# Altium project AHPR_Power_Management_and_Controls_Board.PrjPcb (part 2 of 2)

## Sheet Pi_Interface_and_IO.SchDoc
size 431 x 279 mm; SheetNumber: 5; SheetTotal: 5
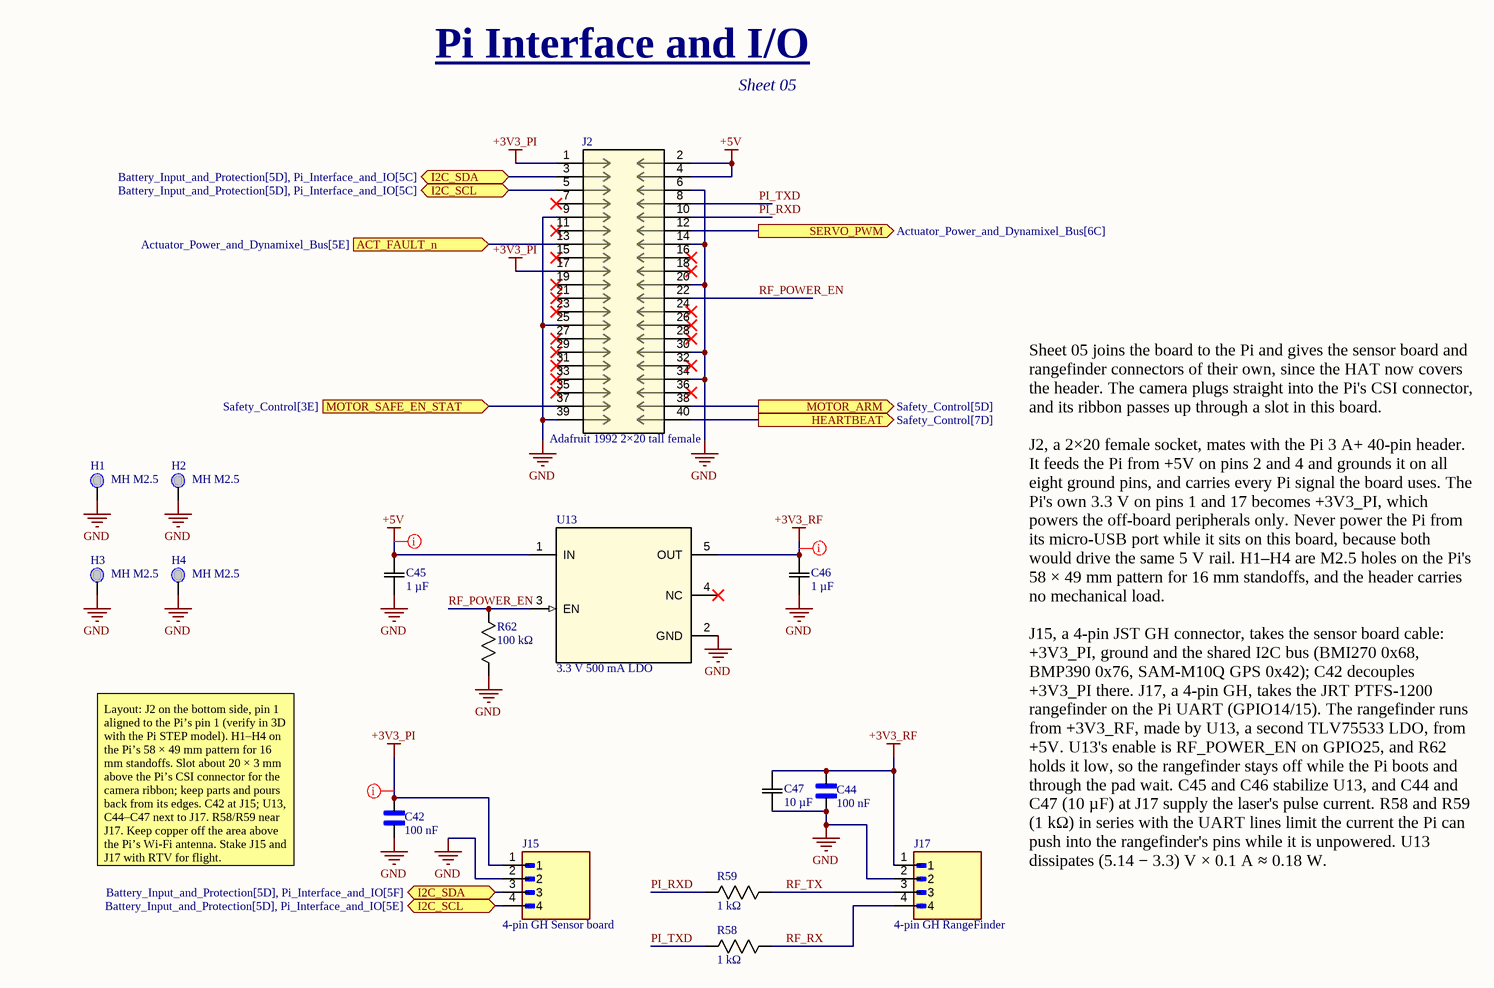
[diagram p4: Pi_Interface_and_IO.SchDoc]

### Parts
C42  100 nF  [CAPC1608X90N]
C44  100 nF  [CAPC1608X90N]
C45  1 µF  [G-188_MUR]
C46  1 µF  [G-188_MUR]
C47  10 µF  [CAP_GRM21_2p15X1p4X1p4_MUR]
H1  MH M2.5  [MH_M2.5_PLATED]
H2  MH M2.5  [MH_M2.5_PLATED]
H3  MH M2.5  [MH_M2.5_PLATED]
H4  MH M2.5  [MH_M2.5_PLATED]
J2  Adafruit 1992 2×20 tall female  [CONN_PRT-14017_SPK]
J15  4-pin GH Sensor board  [JST_SM04B-GHS-TB]
J17  4-pin GH RangeFinder  [JST_SM04B-GHS-TB]
R58  1 kΩ  [RC0603N_YAG]
R59  1 kΩ  [RC0603N_YAG]
R62  100 kΩ  [RC0603N_YAG]
U13  3.3 V 500 mA LDO  [DBV0005A_N]

### Ports
ACT_FAULT_n (in, see Actuator_Power_and_Dynamixel_Bus[5E]), HEARTBEAT (out, see Safety_Control[7D]), I2C_SCL (bidir, see Battery_Input_and_Protection[5D], Pi_Interface_and_IO[5C]), I2C_SCL (bidir, see Battery_Input_and_Protection[5D], Pi_Interface_and_IO[5E]), I2C_SDA (bidir, see Battery_Input_and_Protection[5D], Pi_Interface_and_IO[5C]), I2C_SDA (bidir, see Battery_Input_and_Protection[5D], Pi_Interface_and_IO[5F]), MOTOR_ARM (out, see Safety_Control[5D]), MOTOR_SAFE_EN_STAT (in, see Safety_Control[3E]), SERVO_PWM (out, see Actuator_Power_and_Dynamixel_Bus[6C])

### Nets
+3V3_PI: C42.2 J2.1 J2.17 J15.1
+3V3_RF: C44.2 C46.2 C47.2 J17.1 U13.5(OUT)
+5V: C45.2 J2.2 J2.4 U13.1(IN)
GND: C42.1 C44.1 C45.1 C46.1 C47.1 H1.1(MH) H2.1(MH) H3.1(MH) H4.1(MH) J2.6 J2.9 J2.14 J2.20 J2.25 J2.30 J2.34 J2.39 J15.2 J17.2 R62.1 U13.2(GND)
ACT_FAULT_n: J2.13 ; port ACT_FAULT_n
HEARTBEAT: J2.40 ; port HEARTBEAT
I2C_SCL: J2.5 J15.4 ; port I2C_SCL
I2C_SDA: J2.3 J15.3 ; port I2C_SDA
MOTOR_ARM: J2.38 ; port MOTOR_ARM
MOTOR_SAFE_EN_STAT: J2.37 ; port MOTOR_SAFE_EN_STAT
PI_RXD: J2.10 R59.1
PI_TXD: J2.8 R58.1
RF_POWER_EN: J2.22 R62.2 U13.3(EN)
RF_RX: J17.4 R58.2
RF_TX: J17.3 R59.2
SERVO_PWM: J2.12 ; port SERVO_PWM

Not connected (* = marked no-connect by the designer): J2 7* 11* 15* 16* 18* 19* 21* 23* 24* 26* 27* 28* 29* 31* 32* 33* 35* 36*; U13 4(NC)*

### Layout directives
net class POWER_HI: +5V
net class POWER_LO: +3V3_PI, +3V3_RF

### Notes on the sheet
- Pi Interface and I/O
- Sheet 05
- Layout: J2 on the bottom side, pin 1 aligned to the Pi’s pin 1 (verify in 3D with the Pi STEP model). H1–H4 on the Pi’s 58 × 49 mm pattern for 16 mm standoffs. Slot about 20 × 3 mm above the Pi’s CSI connector for the camera ribbon; keep parts and pours back from its edges. C42 at J15; U13, C44–C47 next to J17. R58/R59 near J17. Keep copper off the area above the Pi’s Wi-Fi antenna. Stake J15 and J17 with RTV for flight.
- Sheet 05 joins the board to the Pi and gives the sensor board and rangefinder connectors of their own, since the HAT now covers the header. The camera plugs straight into the Pi's CSI connector, and its ribbon passes up through a slot in this board.
  J2, a 2×20 female socket, mates with the Pi 3 A+ 40-pin header. It feeds the Pi from +5V on pins 2 and 4 and grounds it on all eight ground pins, and carries every Pi signal the board uses. The Pi's own 3.3 V on pins 1 and 17 becomes +3V3_PI, which powers the off-board peripherals only. Never power the Pi from its micro-USB port while it sits on this board, because both would drive the same 5 V rail. H1–H4 are M2.5 holes on the Pi's 58 × 49 mm pattern for 16 mm standoffs, and the header carries no mechanical load.
  J15, a 4-pin JST GH connector, takes the sensor board cable: +3V3_PI, ground and the shared I2C bus (BMI270 0x68, BMP390 0x76, SAM-M10Q GPS 0x42); C42 decouples +3V3_PI there. J17, a 4-pin GH, takes the JRT PTFS-1200 rangefinder on the Pi UART (GPIO14/15). The rangefinder runs from +3V3_RF, made by U13, a second TLV75533 LDO, from +5V. U13's enable is RF_POWER_EN on GPIO25, and R62 holds it low, so the rangefinder stays off while the Pi boots and through the pad wait. C45 and C46 stabilize U13, and C44 and C47 (10 µF) at J17 supply the laser's pulse current. R58 and R59 (1 kΩ) in series with the UART lines limit the current the Pi can push into the rangefinder's pins while it is unpowered. U13 dissipates (5.14 − 3.3) V × 0.1 A ≈ 0.18 W.
- DWG. NO.
- REV.
- SHT.
- THIS DOCUMENT AND THE DATA DISCLOSED HEREIN OR HEREWITH IS THE PROPERTY OF ALTIUM LIMITED AND MAY BE FREELY DISTRIBUTED IN WHOLE. NO RIGHTS ARE RESERVED OR EXPRESS OR IMPLIED WARANTEE GIVEN.
- REVISION
- DESCRIPTION
- DATE
- APPROVED
- ENG:
- APPROVALS
- PROJECT
- DSN:
- CHK:
- REFERENCE DOCUMENTS
- PROJECT REVISION:
- TITLE
- DOCUMENT REVISION:
- DESIGN ITEM:
- BOM:
- FAB DWG:
- PCB DWG:
- ASSY DWG:
- SCALE:
- SIZE
- B
- CAGE CODE
- FILE NAME
- DWG NO.
- SHEET
- OF
- REV

### Library data of the parts
C42 C44 = GRM188R71H104KA93D: SMD Capacitor X7R(EIA) with Capacitance: 0.10uF Tol. 10%. Rated Voltage: 50Vdc / Murata GRM188R71H104KA93D / 100 nF 50 V X7R / 0603 / Decoupling at J15 (+3V3_PI) and J17 (+3V3_RF) / https://www.digikey.com/en/products/result?keywords=GRM188R71H104KA93D; SnapEDA_Link: https://www.snapeda.com/parts/GRM188R71H104KA93D/Murata/view-part/?ref=snap; Package: 1608 Murata; Value: *; MF: Murata; MP: GRM188R71H104KA93D; Check_prices: https://www.snapeda.com/parts/GRM188R71H104KA93D/Murata/view-part/?ref=eda
C45 C46 = GRM188R71A105KA61D: GRM188R71A105KA61D / Murata GRM188R71A105KA61D / 1 µF 10 V X7R / 0603 / U13 input and output / https://octopart.com/search?q=GRM188R71A105KA61D; Copyright: Copyright (C) 2025 Ultra Librarian. All rights reserved.; Manufacturer_Name: Murata; Manufacturer_Part_Number: GRM188R71A105KA61D
C47 = GRM21BR71A106KA73L: Murata GRM21BR71A106KA73L (LCSC C117956) / 10 µF 10 V X7R / 0805 / Rangefinder bulk at J17, for laser pulse current / https://www.digikey.com/en/products/result?keywords=GRM21BR71A106KA73L; Type: Ceramic Capacitors; Copyright: Copyright (C) 2025 Ultra Librarian. All rights reserved.; Manufacturer_Name: Murata; Manufacturer_Part_Number: GRM21BR71A106KA73L
H1-H4 = MOUNTING_HOLE_M2.5: M2.5 mounting hole, Pi HAT pattern
J2 = PRT-14017: 2×20 female, 2.54 mm, 13.5 mm body, THT, bottom side. / Adafruit 1992 2×20 tall female; Manufacturer_Part_Number: 1992; Copyright: Copyright (C) 2026 Ultra Librarian. All rights reserved.; Manufacturer_Name: Adafruit; RefDes: RefDes; Type: Type; Parameter 1: *; Parameter 2: *
J15 = SM04B-GHS-TB: Connector Header Surface Mount, Right Angle 4 position 0.049 (1.25mm) / JST SM04B-GHS-TB(LF)(SN) / 4-pin GH, 1.25 mm / Right-angle SMD, 2 mounting tabs / Sensor board: +3V3_PI, GND, SDA, SCL / https://www.digikey.com/en/products/result?keywords=SM04B-GHS-TB; MF: JST Sales; SnapEDA_Link: https://www.snapeda.com/parts/SM04B-GHS-TB/JST/view-part/?ref=snap; Package: None; Value: *; MP: SM04B-GHS-TB; Check_prices: https://www.snapeda.com/parts/SM04B-GHS-TB/JST/view-part/?ref=eda
J17 = SM04B-GHS-TB: Connector Header Surface Mount, Right Angle 4 position 0.049 (1.25mm) / JST SM04B-GHS-TB(LF)(SN) / 4-pin GH, 1.25 mm / Right-angle SMD, 2 mounting tabs / Rangefinder: +3V3_RF, GND, RF_TX, RF_RX / https://www.digikey.com/en/products/result?keywords=SM04B-GHS-TB; MF: JST Sales; SnapEDA_Link: https://www.snapeda.com/parts/SM04B-GHS-TB/JST/view-part/?ref=snap; Package: None; Value: *; MP: SM04B-GHS-TB; Check_prices: https://www.snapeda.com/parts/SM04B-GHS-TB/JST/view-part/?ref=eda
R58 R59 = RC0603FR-071KL: RES SMD 1K OHM 1% 1/10W 0603 / Yageo RC0603FR-071KL / 1 kΩ 1 % / 0603 / UART series to the rangefinder: limits back-feed into its pins while it is unpowered / https://www.digikey.com/en/products/result?keywords=RC0603FR-071KL; Copyright: Copyright (C) 2025 Ultra Librarian. All rights reserved.; Manufacturer_Name: Yageo; Manufacturer_Part_Number: RC0603FR-071KL
R62 = RC0603FR-07100KL: RES, 100 k, 1%, 0.1 W, 0603 / Yageo RC0603FR-07100KL / 100 kΩ 1 % / 0603 / RF_POWER_EN pulldown: rangefinder off at boot / https://www.digikey.com/en/products/result?keywords=RC0603FR-07100KL; Copyright: Copyright (C) 2025 Ultra Librarian. All rights reserved.; Manufacturer_Name: Yageo; Manufacturer_Part_Number: RC0603FR-07100KL
U13 = TLV75533PDBVR: 500mA high-PSRR low-I<sub>Q</sub> low-dropout voltage regulator with enable 5-SOT-23 -40 to 125 / TI TLV75533PDBVR / 3.3 V 500 mA LDO with enable / SOT-23-5 / +3V3_RF for the rangefinder; EN = RF_POWER_EN (GPIO25) / https://www.digikey.com/en/products/detail/texas-instruments/TLV75533PDBVR/9356541; Manufacturer_Name: Texas Instruments; TYPE: TYPE; RefDes: RefDes; Copyright: Copyright (C) 2026 Ultra Librarian. All rights reserved.; Manufacturer_Part_Number: TLV75533PDBVR

## Nets that join several sheets
+3V3_LOGIC: Battery_Input_and_Protection (C4.1 R35.1 U3.6), 5V_and_3V3_Regulation (C12.1 TP5.TP U2.5), Safety_Control (13 pins)
+3V3_PI: Actuator_Power_and_Dynamixel_Bus (R57.2), Pi_Interface_and_IO (C42.2 J2.1 J2.17 J15.1)
+5V: 5V_and_3V3_Regulation (10 pins), Actuator_Power_and_Dynamixel_Bus (C38.2 U12.3 U12.4), Pi_Interface_and_IO (C45.2 J2.2 J2.4 U13.1)
GND: Battery_Input_and_Protection (17 pins), 5V_and_3V3_Regulation (12 pins), Actuator_Power_and_Dynamixel_Bus (15 pins), Safety_Control (11 pins), Pi_Interface_and_IO (21 pins)
VBAT_PROTECTED: Battery_Input_and_Protection (13 pins), 5V_and_3V3_Regulation (C6.1 C7.1 U1.2)
ACT_FAULT_n: Actuator_Power_and_Dynamixel_Bus (R57.1 U12.6), Pi_Interface_and_IO (J2.13)
BUCK_EN: Battery_Input_and_Protection (R52.2 R53.1 U4.1), 5V_and_3V3_Regulation (U1.1)
HEARTBEAT: Safety_Control (R54.2 TP9.TP U6.7), Pi_Interface_and_IO (J2.40)
I2C_SCL: Battery_Input_and_Protection (U3.5), Pi_Interface_and_IO (J2.5 J15.4)
I2C_SDA: Battery_Input_and_Protection (U3.4), Pi_Interface_and_IO (J2.3 J15.3)
MOTOR_ARM: Safety_Control (R36.1 U7.1), Pi_Interface_and_IO (J2.38)
MOTOR_SAFE_EN: Actuator_Power_and_Dynamixel_Bus (R56.2 U12.2), Safety_Control (R40.1 TP8.TP U7.5)
MOTOR_SAFE_EN_STAT: Safety_Control (R40.2), Pi_Interface_and_IO (J2.37)
SAFE_OK: Battery_Input_and_Protection (R35.2 U3.3 U4.6), 5V_and_3V3_Regulation (U1.10), Safety_Control (TP7.TP U5.1 U6.8 U7.6)
SERVO_PWM: Actuator_Power_and_Dynamixel_Bus (R45.2), Pi_Interface_and_IO (J2.12)